# Altium schematic sheet STM32H7.SchDoc
size A4; SheetNumber: 3; SheetTotal: 7
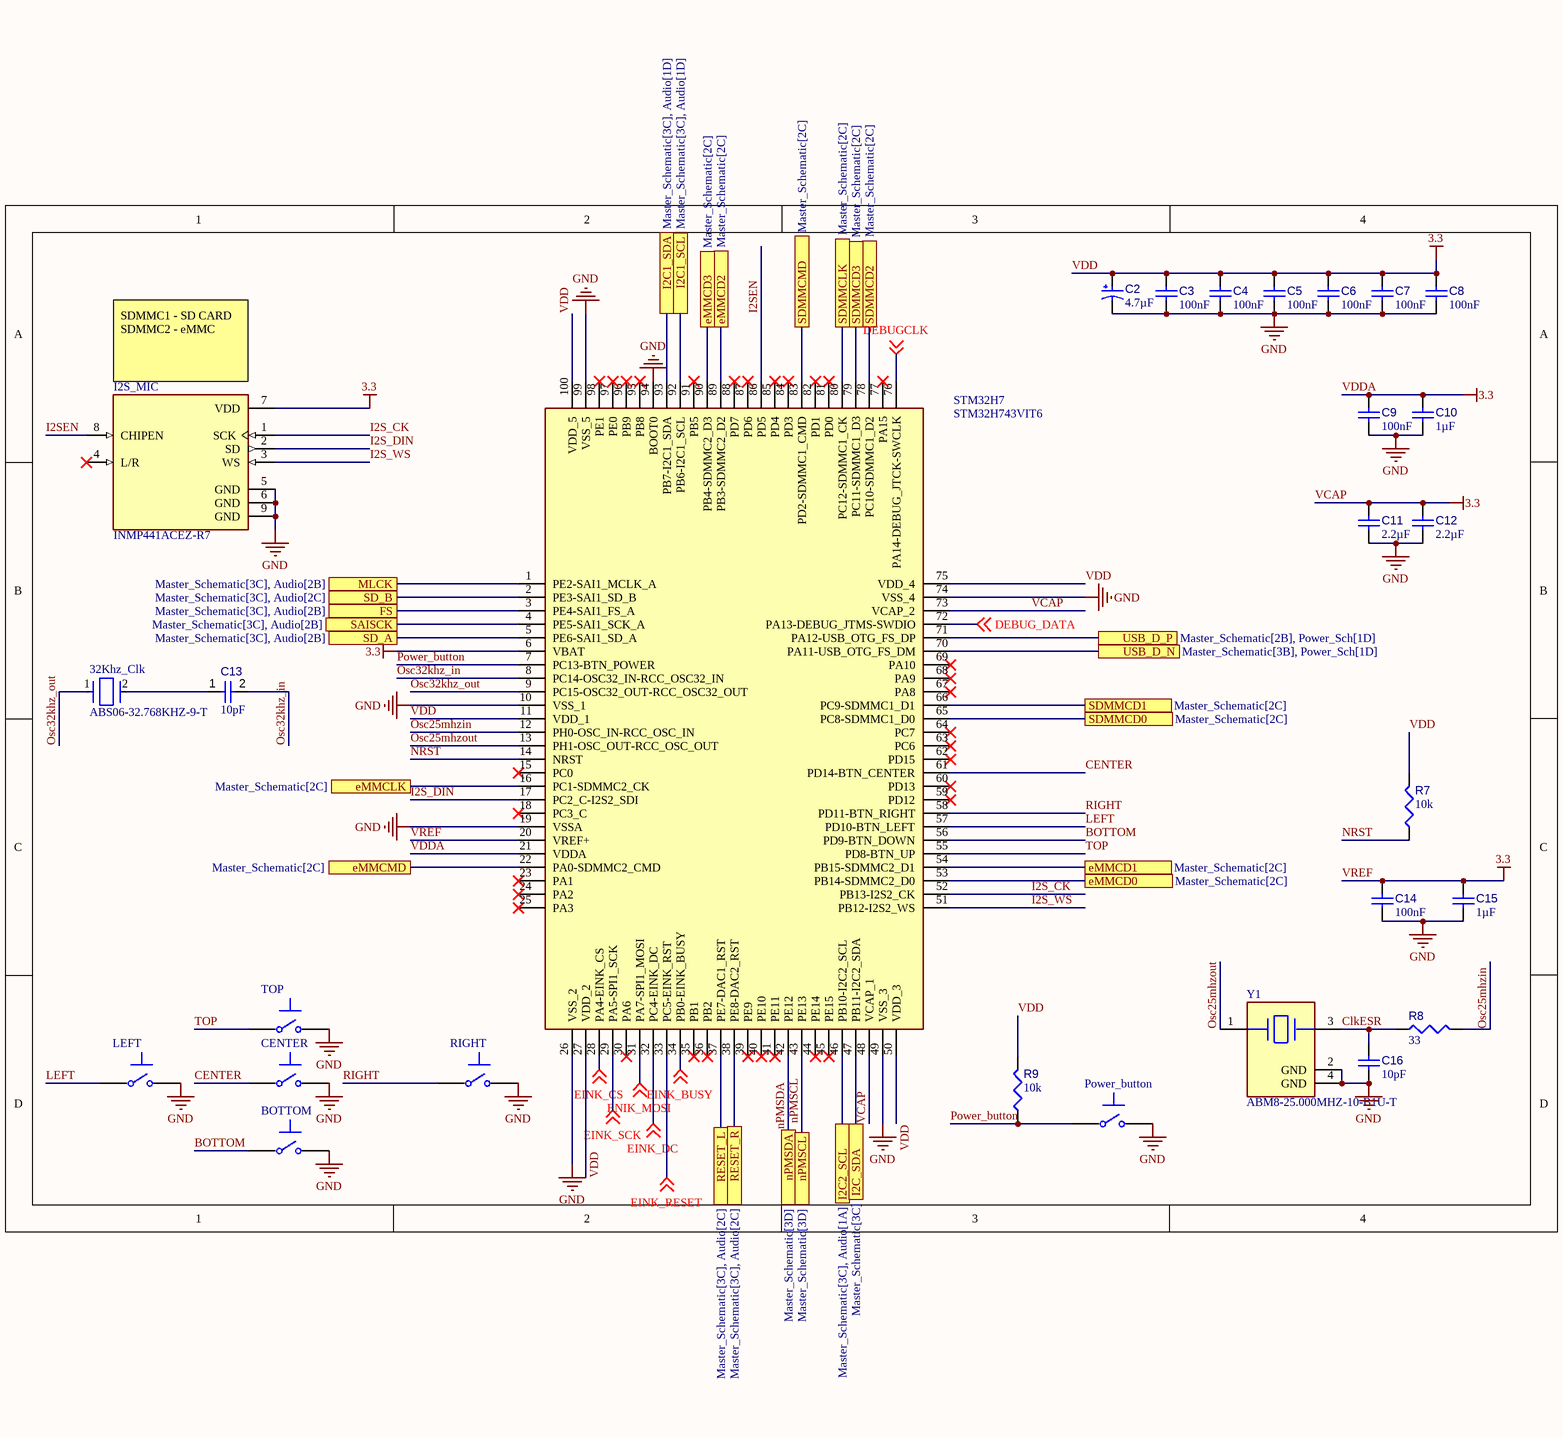
[diagram p0: STM32H7.SchDoc]

## Parts
32Khz_Clk  ABS06-32.768KHZ-9-T  [FP-ABS06-MFG]
BOTTOM  TL1015AF160QG  [FP-TL1015AF160QG-MFG]  (value not drawn)
C2  value 4.7µF  [AVX-TAJ-A-2_L]  (hidden comment: TAJA475K016RNJ)
C3  value 100nF  [CAPC0402(1005)60_L]  (hidden comment: Capacitor 100nF +/-20% 50V 0402)
C4  value 100nF  [CAPC0402(1005)60_L]  (hidden comment: Capacitor 100nF +/-20% 50V 0402)
C5  value 100nF  [CAPC0402(1005)60_L]  (hidden comment: Capacitor 100nF +/-20% 50V 0402)
C6  value 100nF  [CAPC0402(1005)60_L]  (hidden comment: Capacitor 100nF +/-20% 50V 0402)
C7  value 100nF  [CAPC0402(1005)60_L]  (hidden comment: Capacitor 100nF +/-20% 50V 0402)
C8  value 100nF  [CAPC0402(1005)60_L]  (hidden comment: Capacitor 100nF +/-20% 50V 0402)
C9  value 100nF  [CAPC0402(1005)60_L]  (hidden comment: Capacitor 100nF +/-20% 50V 0402)
C10  value 1µF  [CAPC1005X55X25LL05T10]  (hidden comment: Capacitor 1 uF +/- 10% 6.3 V 0402)
C11  value 2.2µF  [CAPC0402(1005)60_L]  (hidden comment: Capacitor 2,2µF +/-20% 10V 0402)
C12  value 2.2µF  [CAPC0402(1005)60_L]  (hidden comment: Capacitor 2,2µF +/-20% 10V 0402)
C13  value 10pF  [CAPC1005X55X25ML05T05]  (hidden comment: Capacitor 10 pF +/- 5% 50 V 0402)
C14  value 100nF  [CAPC1608X90X40NL10T20]  (hidden comment: Capacitor 100 nF +/-10% 50 V 0603)
C15  value 1µF  [CAPC1005X55X25LL05T10]  (hidden comment: Capacitor 1 uF +/- 10% 6.3 V 0402)
C16  value 10pF  [CAPC1608X87X35NL15T15]  (hidden comment: Capacitor 10 pF +/- 0.25 pF 50 V 0603)
CENTER  TL1015AF160QG  [FP-TL1015AF160QG-MFG]  (value not drawn)
I2S_MIC  INMP441ACEZ-R7  [MIC_INMP441ACEZ-R7]
LEFT  TL1015AF160QG  [FP-TL1015AF160QG-MFG]  (value not drawn)
Power_button  TL1015AF160QG  [FP-TL1015AF160QG-MFG]  (value not drawn)
R7  value 10k  [RESC0402(1005)_L]  (hidden comment: 10KR2F)
R8  value 33  [RESC0402(1005)_L]  (hidden comment: 33R2J)
R9  value 10k  [RESC0402(1005)_L]  (hidden comment: 10KR2F)
RIGHT  TL1015AF160QG  [FP-TL1015AF160QG-MFG]  (value not drawn)
STM32H7  STM32H743VIT6  [QFP50P1600X1600X160-100N]
TOP  TL1015AF160QG  [FP-TL1015AF160QG-MFG]  (value not drawn)
Y1  ABM8-25.000MHZ-10-B1U-T  [FP-ABM8-MFG]

## Ports
eMMCD0 (see Master_Schematic[2C]), eMMCD1 (see Master_Schematic[2C]), eMMCD2 (see Master_Schematic[2C]), eMMCD3 (see Master_Schematic[2C]), eMMCLK (see Master_Schematic[2C]), eMMCMD (see Master_Schematic[2C]), FS (see Master_Schematic[3C], Audio[2B]), I2C1_SCL (see Master_Schematic[3C], Audio[1D]), I2C1_SDA (see Master_Schematic[3C], Audio[1D]), I2C2_SCL (see Master_Schematic[3C], Audio[1A]), I2C_SDA (see Master_Schematic[3C]), MLCK (see Master_Schematic[3C], Audio[2B]), nPMSCL (see Master_Schematic[3D]), nPMSDA (see Master_Schematic[3D]), RESET_L (see Master_Schematic[3C], Audio[2C]), RESET_R (see Master_Schematic[3C], Audio[2C]), SAISCK (see Master_Schematic[3C], Audio[2B]), SD_A (see Master_Schematic[3C], Audio[2B]), SD_B (see Master_Schematic[3C], Audio[2C]), SDMMCD0 (see Master_Schematic[2C]), SDMMCD1 (see Master_Schematic[2C]), SDMMCD2 (see Master_Schematic[2C]), SDMMCD3 (see Master_Schematic[2C]), SDMMCLK (see Master_Schematic[2C]), SDMMCMD (see Master_Schematic[2C]), USB_D_N (see Master_Schematic[3B], Power_Sch[1D]), USB_D_P (see Master_Schematic[2B], Power_Sch[1D])

## Nets
GND: BOTTOM.2 C2.2 C3.1 C4.1 C5.1 C6.1 C7.1 C8.1 C9.1 C10.1 C11.1 C12.1 C14.1 C15.1 C16.1 CENTER.2 I2S_MIC.5(GND) I2S_MIC.6(GND) I2S_MIC.9(GND) LEFT.2 Power_button.2 RIGHT.2 STM32H7.10(VSS_1) STM32H7.19(VSSA) STM32H7.26(VSS_2) STM32H7.49(VSS_3) STM32H7.74(VSS_4) STM32H7.94(BOOT0) STM32H7.99(VSS_5) TOP.2 Y1.2(GND) Y1.4(GND)
VCAP: C2.1 C3.2 C4.2 C5.2 C6.2 C7.2 C8.2 C9.2 C10.2 C11.2 C12.2 C14.2 C15.2 I2S_MIC.7(VDD) R7.2 R9.2 STM32H7.6(VBAT) STM32H7.11(VDD_1) STM32H7.20(VREF+) STM32H7.21(VDDA) STM32H7.27(VDD_2) STM32H7.48(VCAP_1) STM32H7.50(VDD_3) STM32H7.73(VCAP_2) STM32H7.75(VDD_4) STM32H7.100(VDD_5)  [also labelled 3.3, VDD, VDDA, VREF]
BOTTOM: BOTTOM.1 STM32H7.56(PD9-BTN_DOWN)
CENTER: CENTER.1 STM32H7.61(PD14-BTN_CENTER)
ClkESR: C16.2 R8.1 Y1.3
DEBUG_DATA: STM32H7.72(PA13-DEBUG_JTMS-SWDIO) ; off-sheet DEBUG_DATA
DEBUGCLK: STM32H7.76(PA14-DEBUG_JTCK-SWCLK) ; off-sheet DEBUGCLK
EINK_BUSY: STM32H7.34(PB0-EINK_BUSY) ; off-sheet EINK_BUSY
EINK_CS: STM32H7.28(PA4-EINK_CS) ; off-sheet EINK_CS
EINK_DC: STM32H7.32(PC4-EINK_DC) ; off-sheet EINK_DC
EINK_RESET: STM32H7.33(PC5-EINK_RST) ; off-sheet EINK_RESET
EINK_SCK: STM32H7.29(PA5-SPI1_SCK) ; off-sheet EINK_SCK
eMMCD0: STM32H7.53(PB14-SDMMC2_D0) ; port eMMCD0
eMMCD1: STM32H7.54(PB15-SDMMC2_D1) ; port eMMCD1
eMMCD2: STM32H7.89(PB3-SDMMC2_D2) ; port eMMCD2
eMMCD3: STM32H7.90(PB4-SDMMC2_D3) ; port eMMCD3
eMMCLK: STM32H7.16(PC1-SDMMC2_CK) ; port eMMCLK
eMMCMD: STM32H7.22(PA0-SDMMC2_CMD) ; port eMMCMD
ENIK_MOSI: STM32H7.31(PA7-SPI1_MOSI) ; off-sheet ENIK_MOSI
FS: STM32H7.3(PE4-SAI1_FS_A) ; port FS
I2C1_SCL: STM32H7.92(PB6-I2C1_SCL) ; port I2C1_SCL
I2C1_SDA: STM32H7.93(PB7-I2C1_SDA) ; port I2C1_SDA
I2C2_SCL: STM32H7.46(PB10-I2C2_SCL) ; port I2C2_SCL
I2C_SDA: STM32H7.47(PB11-I2C2_SDA) ; port I2C_SDA
I2S_CK: I2S_MIC.1(SCK) STM32H7.52(PB13-I2S2_CK)
I2S_DIN: I2S_MIC.2(SD) STM32H7.17(PC2_C-I2S2_SDI)
I2S_WS: I2S_MIC.3(WS) STM32H7.51(PB12-I2S2_WS)
I2SEN: I2S_MIC.8(CHIPEN) STM32H7.86(PD5)
LEFT: LEFT.1 STM32H7.57(PD10-BTN_LEFT)
MLCK: STM32H7.1(PE2-SAI1_MCLK_A) ; port MLCK
nPMSCL: STM32H7.43(PE13) ; port nPMSCL
nPMSDA: STM32H7.42(PE12) ; port nPMSDA
NRST: R7.1 STM32H7.14(NRST)
Osc25mhzin: R8.2 STM32H7.12(PH0-OSC_IN-RCC_OSC_IN)
Osc25mhzout: STM32H7.13(PH1-OSC_OUT-RCC_OSC_OUT) Y1.1
Osc32khz_in: C13.2 STM32H7.8(PC14-OSC32_IN-RCC_OSC32_IN)
Osc32khz_out: 32Khz_Clk.1 STM32H7.9(PC15-OSC32_OUT-RCC_OSC32_OUT)
Power_button: Power_button.1 R9.1 STM32H7.7(PC13-BTN_POWER)
RESET_L: STM32H7.37(PE7-DAC1_RST) ; port RESET_L
RESET_R: STM32H7.38(PE8-DAC2_RST) ; port RESET_R
RIGHT: RIGHT.1 STM32H7.58(PD11-BTN_RIGHT)
SAISCK: STM32H7.4(PE5-SAI1_SCK_A) ; port SAISCK
SD_A: STM32H7.5(PE6-SAI1_SD_A) ; port SD_A
SD_B: STM32H7.2(PE3-SAI1_SD_B) ; port SD_B
SDMMCD0: STM32H7.65(PC8-SDMMC1_D0) ; port SDMMCD0
SDMMCD1: STM32H7.66(PC9-SDMMC1_D1) ; port SDMMCD1
SDMMCD2: STM32H7.78(PC10-SDMMC1_D2) ; port SDMMCD2
SDMMCD3: STM32H7.79(PC11-SDMMC1_D3) ; port SDMMCD3
SDMMCLK: STM32H7.80(PC12-SDMMC1_CK) ; port SDMMCLK
SDMMCMD: STM32H7.83(PD2-SDMMC1_CMD) ; port SDMMCMD
TOP: STM32H7.55(PD8-BTN_UP) TOP.1
USB_D_N: STM32H7.70(PA11-USB_OTG_FS_DM) ; port USB_D_N
USB_D_P: STM32H7.71(PA12-USB_OTG_FS_DP) ; port USB_D_P
Net32Khz_Clk_2: 32Khz_Clk.2 C13.1

Not connected (* = marked no-connect by the designer): I2S_MIC 4(L/R)*; STM32H7 15(PC0)* 18(PC3_C)* 23(PA1)* 24(PA2)* 25(PA3)* 30(PA6)* 35(PB1)* 36(PB2)* 39(PE9)* 40(PE10)* 41(PE11)* 44(PE14)* 45(PE15)* 59(PD12)* 60(PD13)* 62(PD15)* 63(PC6)* 64(PC7)* 67(PA8)* 68(PA9)* 69(PA10)* 77(PA15)* 81(PD0)* 82(PD1)* 84(PD3)* 85(PD4)* 87(PD6)* 88(PD7)* 91(PB5)* 95(PB8)* 96(PB9)* 97(PE0)* 98(PE1)*

## Notes on the sheet
- (near I2S_MIC) SDMMC1 - SD CARD
  SDMMC2 - eMMC

## Library data of the parts
32Khz_Clk = CMP-27762-015421-1: Crystal 32.768kHz ±20ppm (Tol) 9pF FUND 90kΩ 2-Pin Mini-CSMD T/R; ESR (Equivalent Series Resistance): 90kR; Max Operating Temperature: 85°C; Frequency Tolerance: 20ppm; Case/Package: CSMD; Termination: SMD/SMT; RoHS Compliant: Yes; Height: 0.6mm; Load Capacitance: 9pF; Packaging: Tape and Reel; Depth: 1.2mm; Tolerance: 20ppm; Frequency: 32.768kHz; Series: ABS06; Width: 1.2mm; Length: 2mm; Number of Pins: 2; Min Operating Temperature: -40°C; Mount: Surface Mount; Lead Free: Lead Free; Package Quantity: 3000
BOTTOM CENTER LEFT Power_button RIGHT TOP = CMP-17879-000003-1: SWITCH TACTILE SPST-NO 0.05A 12V; Actuator Type: Standard; Actuator Length: 0.5mm; Contact Current Rating: 50mA; Mechanical Life: 200000Cycles; Switch Function: Off-Mom; Switch Travel: 0.2mm; Illumination Type: Non-Illuminated; Operating Force: 160gf; Actuator Material: Nylon; Electrical Life: 50000Cycles; Throw Configuration: SPST; Contact Resistance: 100mR; Orientation: Straight; Max Voltage Rating (DC): 12V; Max Operating Temperature: 70°C; Package Quantity: 1; Contact Material: Silver; Packaging: Tape and Reel; Mount: Surface Mount; Color: Beige; Termination: Gull Wing; Case/Package: SMD/SMT; Voltage Rating (DC): 12V; Contact Plating: Silver; REACH SVHC: No SVHC; Min Operating Temperature: -20°C; Current Rating: 50mA; Lead Free: Lead Free
C2 = CMP-001-00042-7: Standard Tantalum, 4.7 uF, +/- 10%, 16 V, -55 to 125 degC, 1206 (3216 Metric), RoHS, Tape and Reel; Manufacturer: AVX; Resistance: 4Ohm; Voltage Rating: 16V; Manufacturer URL: http://www.avx.com/; Pins: 2; Max Operating Temperature: 125°C; Case/Package: 1206; Package Description: 2-Pin Surface Mount Device, Body 3.2 x 1.65 mm; Datasheet URL: http://datasheets.avx.com/TAJ.pdf; Min Operating Temperature: -55°C; RoHS Compliant: True; Package Reference: TAJ-A-2; ESR: 4Ohm; Capacitor Type: Tantalum; Packaging: TapeandReel; Datasheet Version: Feb-16; Tolerance: 10%; Mounting Technology: SM; Package Quantity: 2000
C3-C9 = CMP-001-00067-3: Chip Capacitor, 100nF +/-20%, 50V, 0402, Thickness 0.6 mm; Tolerance: 10%; Min Operating Temperature: -55°C; Pins: 2; Case/Package: 0402; Max Operating Temperature: 85°C; Voltage Rating: 50V; Mounting Technology: SMT
C10 C15 = CMP-001-00008-6: Chip Capacitor, 1 uF, +/- 10%, 6.3 V, 0402 (1005 Metric); Capacitor Type: Ceramic; Voltage Rating: 6.3V; Max Operating Temperature: 85°C; Mounting Technology: SM; Tolerance: 10%; Case/Package: 0402; RoHS Compliant: True; Min Operating Temperature: -55°C; Pins: 2
C11 C12 = CMP-001-00056-4: Chip Capacitor, 2,2µF +/-20%, 10V, 0402, Thickness 0.6 mm; Tolerance: 10%; Mounting Technology: SMT; Max Operating Temperature: 85°C; Case/Package: 0402; Pins: 2; Min Operating Temperature: -55°C; Voltage Rating: 10V
C13 = CMP-001-00013-6: Chip Capacitor, 10 pF, +/- 5%, 50 V, 0402 (1005 Metric); Capacitor Type: Ceramic; Voltage Rating: 50V; Max Operating Temperature: 125°C; Pins: 2; Mounting Technology: SM; Tolerance: 5%; RoHS Compliant: True; Case/Package: 0402; Min Operating Temperature: -55°C
C14 = CMP-001-00017-6: Chip Capacitor, 100 nF, +/- 10%, 50 V, 0603 (1608 Metric); Voltage Rating: 50V; Capacitor Type: Ceramic; Tolerance: 10%; Mounting Technology: SM; Max Operating Temperature: 125°C; RoHS Compliant: True; Pins: 2; Case/Package: 0603; Min Operating Temperature: -55°C
C16 = CMP-001-00012-6: Chip Capacitor, 10 pF, +/- 0.25 pF, 50 V, 0603 (1608 Metric); Tolerance: 0.25%; Capacitor Type: Ceramic; Voltage Rating: 50V; Max Operating Temperature: 125°C; RoHS Compliant: True; Mounting Technology: SM; Pins: 2; Case/Package: 0603; Min Operating Temperature: -55°C
I2S_MIC = CMP-062-000000-1: 60 Hz ~ 15 kHz Digital, I2S Microphone MEMS (Silicon) 1.62 V ~ 3.63 V Omnidirectional (-26dB Â±3dB @ 94dB SPL) Solder Pads; MF: TDK InvenSense; Source: INMP441ACEZ-R7.SchLib; Check_prices: https://www.snapeda.com/parts/INMP441ACEZ-R7/TDK/view-part/?ref=eda; MP: INMP441ACEZ-R7; Design Item ID: INMP441ACEZ-R7; Pin Count: 9; Component Type: Standard; SnapEDA_Link: https://www.snapeda.com/parts/INMP441ACEZ-R7/TDK/view-part/?ref=snap; Package: LGA-9 TDK InvenSense; Value: *
R7 R9 = CMP-009-00066-2: 10K 0.063W 1% 0402 (1005 Metric)  SMD; Power: 63mW; Case/Package: 0402; Mounting Technology: SMT; Pins: 2; Tolerance: 1%
R8 = CMP-009-00096-2: 33R 0.063W 5% 0402 (1005 Metric)  SMD; Power: 63mW; Mounting Technology: SMT; Tolerance: 5%; Case/Package: 0402; Pins: 2
STM32H7 = CMP-060-000000-1: ARM Microcontrollers - MCU High-performance and DSP with DP-FPU, ARM Cortex-M7 MCU with 2MBytes Flash, 1MB RAM, 400 MHz CPU, Art Accelerator, L1 cache, external memory interface, large set of peripherals; Manufacturer_Name: STMicroelectronics; Geometry.Height: 1.6mm; Manufacturer_Part_Number: STM32H743VIT6; Source: STM32H743VIT6.SchLib; Design Item ID: STM32H743VIT6; Datasheet Link: https://www.st.com/resource/en/datasheet/stm32h743vi.pdf
Y1 = CMP-27762-006353-1: Crystal 25MHz ±10ppm 10pF SMD-4 3.2mm x 2.5mm